# Altium schematic sheet DesignDetails.SchDoc
size A3; SheetNumber: 1; SheetTotal: 3
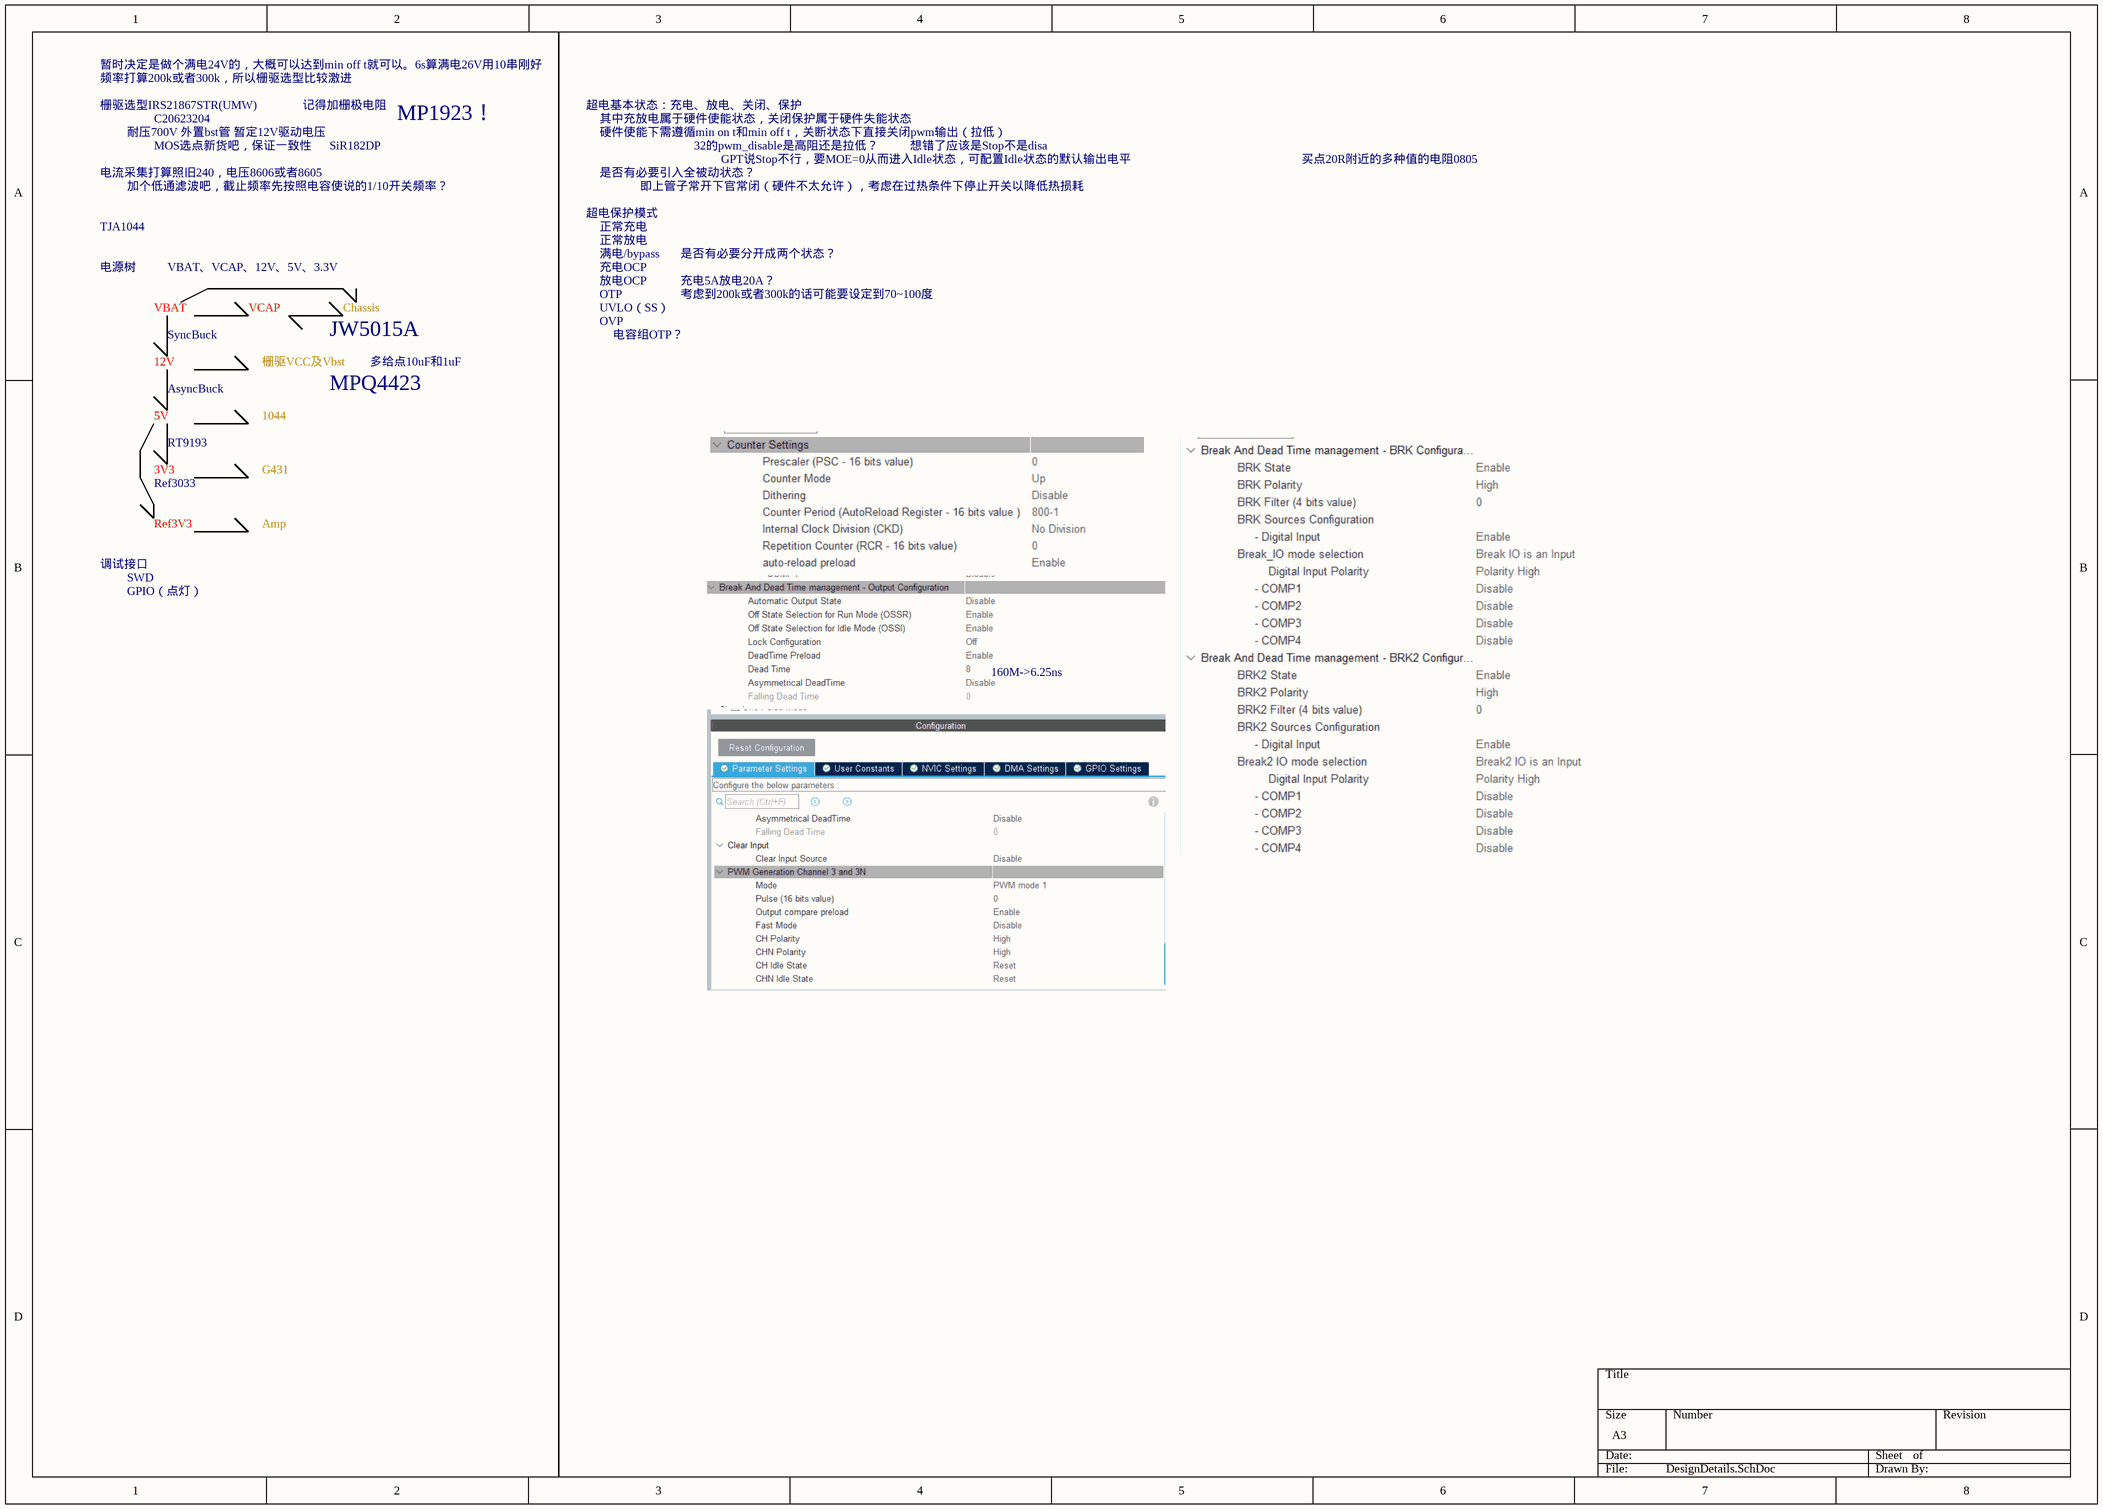
[diagram p0: DesignDetails.SchDoc]

## Notes on the sheet
- 栅驱选型IRS21867STR(UMW)
- 暂时决定是做个满电24V的，大概可以达到min off t就可以。6s算满电26V用10串刚好
- 频率打算200k或者300k，所以栅驱选型比较激进
- 记得加栅极电阻
- 超电基本状态：充电、放电、关闭、保护
- 电流采集打算照旧240，电压8606或者8605
- 耐压700V 外置bst管 暂定12V驱动电压
- C20623204
- MOS选点新货吧，保证一致性
- SiR182DP
- MP1923！
- 其中充放电属于硬件使能状态，关闭保护属于硬件失能状态
- 硬件使能下需遵循min on t和min off t，关断状态下直接关闭pwm输出（拉低）
- 是否有必要引入全被动状态？
- 32的pwm_disable是高阻还是拉低？
- GPT说Stop不行，要MOE=0从而进入Idle状态，可配置Idle状态的默认输出电平
- 想错了应该是Stop不是disa
- 买点20R附近的多种值的电阻0805
- TJA1044
- 加个低通滤波吧，截止频率先按照电容使说的1/10开关频率？
- 超电保护模式
- 正常充电
- 正常放电
- 即上管子常开下官常闭（硬件不太允许），考虑在过热条件下停止开关以降低热损耗
- 电源树
- VBAT
- VBAT、VCAP、12V、5V、3.3V
- VCAP
- Chassis
- 满电/bypass
- 放电OCP
- OTP
- UVLO（SS）
- 充电OCP
- 是否有必要分开成两个状态？
- 充电5A放电20A？
- 考虑到200k或者300k的话可能要设定到70~100度
- 12V
- SyncBuck
- 栅驱VCC及Vbst
- JW5015A
- 多给点10uF和1uF
- OVP
- 电容组OTP？
- 5V
- AsyncBuck
- RT9193
- 1044
- MPQ4423
- 3V3
- Ref3033
- G431
- 调试接口
- SWD
- Ref3V3
- Amp
- GPIO（点灯）
- 160M->6.25ns